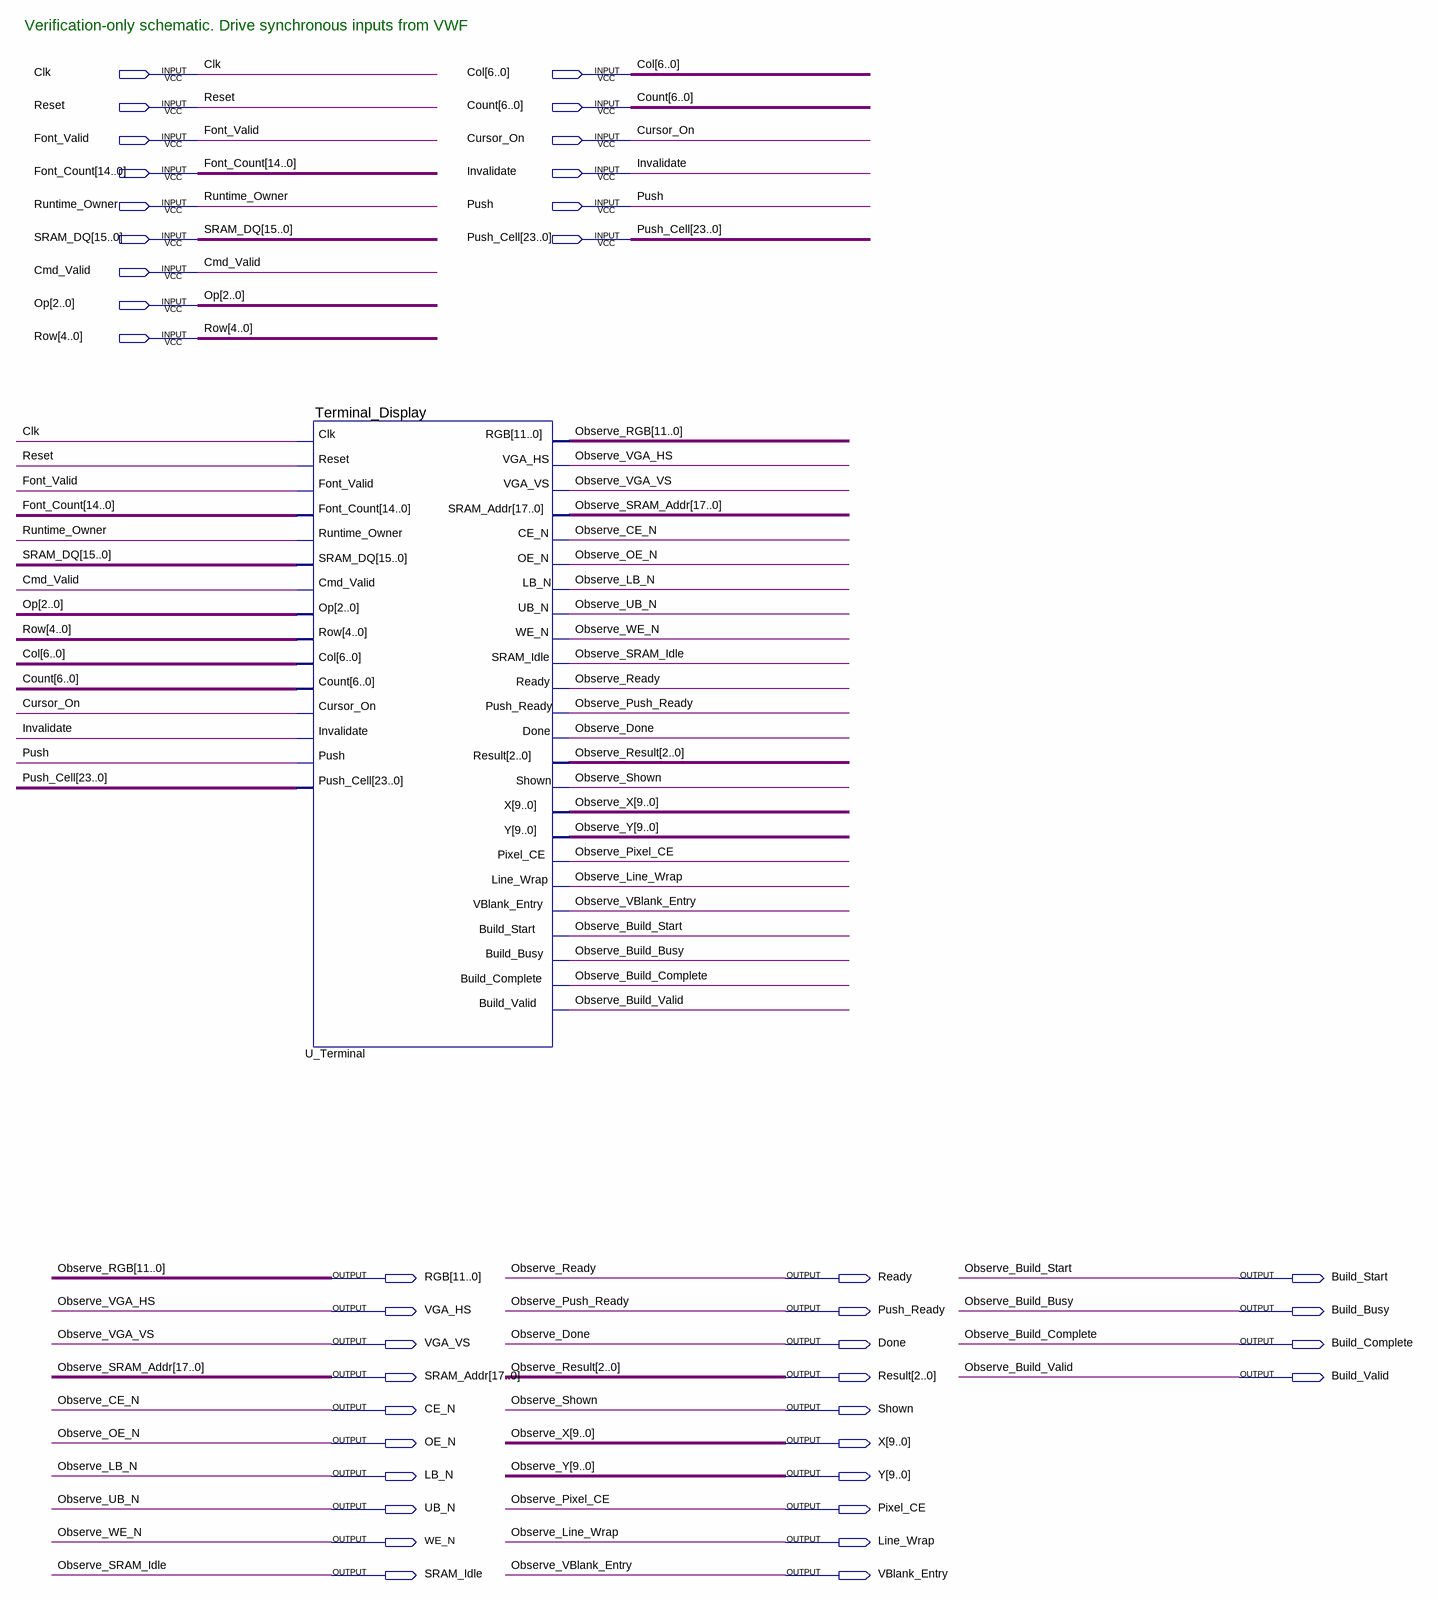
[diagram p0: schematic sheet]
// Quartus schematic Phase3_Probe.bdf as structural Verilog: 1 symbols, 39 pins
module Phase3_Probe (
  input  Clk,
  input  [6:0] Col,
  input  Reset,
  input  [6:0] Count,
  input  Font_Valid,
  input  Cursor_On,
  input  [14:0] Font_Count,
  input  Invalidate,
  input  Runtime_Owner,
  input  Push,
  input  [15:0] SRAM_DQ,
  input  [23:0] Push_Cell,
  input  Cmd_Valid,
  input  [2:0] Op,
  input  [4:0] Row,
  output [11:0] RGB,
  output Ready,
  output Build_Start,
  output VGA_HS,
  output Push_Ready,
  output Build_Busy,
  output VGA_VS,
  output Done,
  output Build_Complete,
  output [17:0] SRAM_Addr,
  output [2:0] Result,
  output Build_Valid,
  output CE_N,
  output Shown,
  output OE_N,
  output [9:0] X,
  output LB_N,
  output [9:0] Y,
  output UB_N,
  output Pixel_CE,
  output WE_N,
  output Line_Wrap,
  output SRAM_Idle,
  output VBlank_Entry
);

  Terminal_Display U_Terminal (
    .Clk(Clk), .Reset(Reset), .Font_Valid(Font_Valid), .Font_Count(Font_Count),
    .Runtime_Owner(Runtime_Owner), .SRAM_DQ(SRAM_DQ), .Cmd_Valid(Cmd_Valid), .Op(Op), .Row(Row), .Col(Col),
    .Count(Count), .Cursor_On(Cursor_On), .Invalidate(Invalidate), .Push(Push), .Push_Cell(Push_Cell),
    .RGB(RGB), .VGA_HS(VGA_HS), .VGA_VS(VGA_VS), .SRAM_Addr(SRAM_Addr), .CE_N(CE_N), .OE_N(OE_N),
    .LB_N(LB_N), .UB_N(UB_N), .WE_N(WE_N), .SRAM_Idle(SRAM_Idle), .Ready(Ready), .Push_Ready(Push_Ready),
    .Done(Done), .Result(Result), .Shown(Shown), .X(X), .Y(Y), .Pixel_CE(Pixel_CE), .Line_Wrap(Line_Wrap),
    .VBlank_Entry(VBlank_Entry), .Build_Start(Build_Start), .Build_Busy(Build_Busy),
    .Build_Complete(Build_Complete), .Build_Valid(Build_Valid));

  // Other names for the same wires on the sheet: Observe_Build_Busy = Build_Busy;
  //   Observe_Build_Complete = Build_Complete; Observe_Build_Start = Build_Start; Observe_Build_Valid = Build_Valid;
  //   Observe_CE_N = CE_N; Observe_Done = Done; Observe_LB_N = LB_N; Observe_Line_Wrap = Line_Wrap;
  //   Observe_OE_N = OE_N; Observe_Pixel_CE = Pixel_CE; Observe_Push_Ready = Push_Ready; Observe_Ready = Ready;
  //   Observe_Result[2:0] = Result; Observe_RGB[11:0] = RGB; Observe_Shown = Shown;
  //   Observe_SRAM_Addr[17:0] = SRAM_Addr; Observe_SRAM_Idle = SRAM_Idle; Observe_UB_N = UB_N;
  //   Observe_VBlank_Entry = VBlank_Entry; Observe_VGA_HS = VGA_HS; Observe_VGA_VS = VGA_VS; Observe_WE_N = WE_N;
  //   Observe_X[9:0] = X; Observe_Y[9:0] = Y

  // Notes on the sheet:
  //   Verification-only schematic. Drive synchronous inputs from VWF
endmodule
